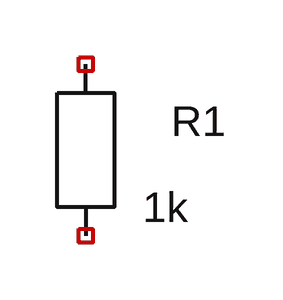
[diagram p0: schematic window_no_size.asc]
window_no_size.asc, the LTspice schematic file:
Version 4
SHEET 1 880 680
SYMBOL res 96 160 R0
WINDOW 0 48 -16 Left
SYMATTR InstName R1
SYMATTR Value 1k

The netlist it stands for:
* window_no_size.asc
R1 NC_01 NC_02 1k
.backanno
.end